# Altium schematic sheet Top-Sheet.SchDoc
size A4; DocumentNumber: 1; SheetNumber: 1; SheetTotal: 3
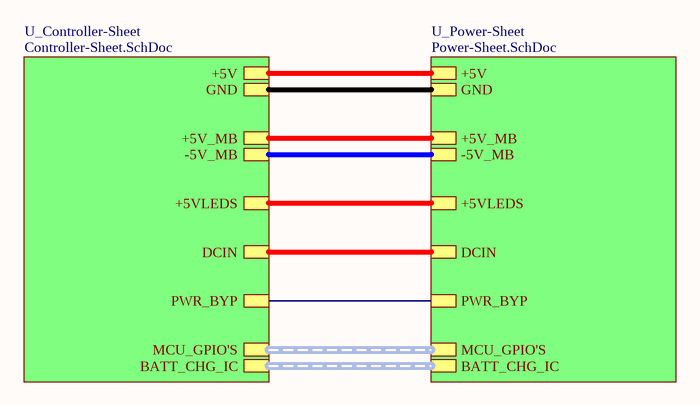
[diagram p0: Top-Sheet.SchDoc]

## Sub-sheets
U_Controller-Sheet = Controller-Sheet.SchDoc: +5V, GND, +5V_MB, -5V_MB, +5VLEDS, DCIN, PWR_BYP, MCU_GPIO'S (harness MCU_GPIO'S), BATT_CHG_IC (harness BATT_CHG_IC)
U_Power-Sheet = Power-Sheet.SchDoc: +5V, GND, +5V_MB, -5V_MB, +5VLEDS, DCIN, PWR_BYP, MCU_GPIO'S (harness MCU_GPIO'S), BATT_CHG_IC (harness BATT_CHG_IC)

## Nets
(unnamed): sheet U_Controller-Sheet/+5V, sheet U_Power-Sheet/+5V
(unnamed): sheet U_Controller-Sheet/GND, sheet U_Power-Sheet/GND
(unnamed): sheet U_Controller-Sheet/+5V_MB, sheet U_Power-Sheet/+5V_MB
(unnamed): sheet U_Controller-Sheet/-5V_MB, sheet U_Power-Sheet/-5V_MB
(unnamed): sheet U_Controller-Sheet/+5VLEDS, sheet U_Power-Sheet/+5VLEDS
(unnamed): sheet U_Controller-Sheet/DCIN, sheet U_Power-Sheet/DCIN
(unnamed): sheet U_Controller-Sheet/PWR_BYP, sheet U_Power-Sheet/PWR_BYP

## Buses and harness runs
harness sheet U_Controller-Sheet/BATT_CHG_IC = sheet U_Power-Sheet/BATT_CHG_IC
harness sheet U_Controller-Sheet/MCU_GPIO'S = sheet U_Power-Sheet/MCU_GPIO'S

## Notes on the sheet
- File:
- Title:
- Date:
- Page
- Num:
- Total:
- Drawn By: Huzaifa Ali